# Altium schematic sheet Top-Sheet.SchDoc
size 420 x 297 mm; SheetNumber: 1; SheetTotal: 6
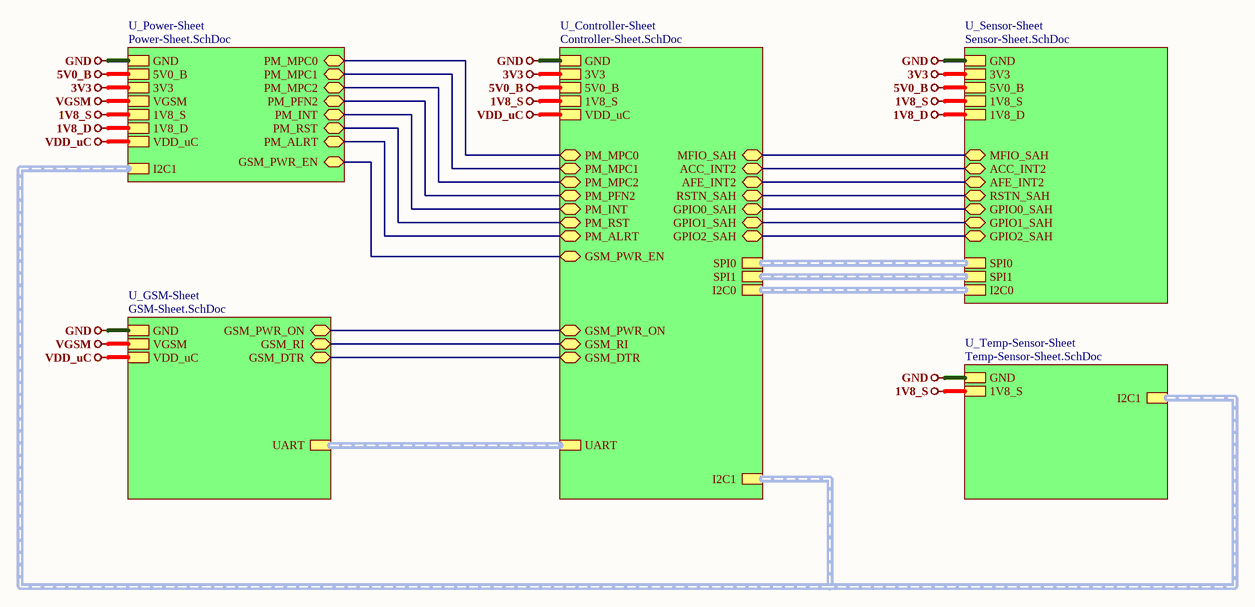
[diagram p0: Top-Sheet.SchDoc]

## Sub-sheets
U_Controller-Sheet = Controller-Sheet.SchDoc: I2C0 (harness I2C), GND, 3V3, I2C1 (harness I2C), SPI0 (harness I2C), SPI1 (harness I2C), UART (harness I2C), 5V0_B, 1V8_S, VDD_uC, PM_MPC0 (bidir), PM_MPC1 (bidir), PM_MPC2 (bidir), PM_PFN2 (bidir), PM_INT (bidir), PM_RST (bidir), PM_ALRT (bidir), GSM_PWR_EN (bidir), GSM_PWR_ON (bidir), GSM_RI (bidir), GSM_DTR (bidir), MFIO_SAH (bidir), ACC_INT2 (bidir), AFE_INT2 (bidir), RSTN_SAH (bidir), GPIO0_SAH (bidir), GPIO1_SAH (bidir), GPIO2_SAH (bidir)
U_GSM-Sheet = GSM-Sheet.SchDoc: GND, GSM_PWR_ON (bidir), UART (harness I2C), VGSM, VDD_uC, GSM_RI (bidir), GSM_DTR (bidir)
U_Power-Sheet = Power-Sheet.SchDoc: 5V0_B, GND, 3V3, VGSM, 1V8_S, 1V8_D, VDD_uC, I2C1 (harness I2C), PM_MPC0 (bidir), PM_MPC1 (bidir), PM_MPC2 (bidir), PM_PFN2 (bidir), PM_INT (bidir), PM_RST (bidir), PM_ALRT (bidir), GSM_PWR_EN (bidir)
U_Sensor-Sheet = Sensor-Sheet.SchDoc: I2C0 (harness I2C), GND, 3V3, SPI0 (harness I2C), SPI1 (harness I2C), 5V0_B, 1V8_S, 1V8_D, MFIO_SAH (bidir), ACC_INT2 (bidir), AFE_INT2 (bidir), RSTN_SAH (bidir), GPIO0_SAH (bidir), GPIO1_SAH (bidir), GPIO2_SAH (bidir)
U_Temp-Sensor-Sheet = Temp-Sensor-Sheet.SchDoc: I2C1 (harness I2C), GND, 1V8_S

## Nets
1V8_D: sheet U_Power-Sheet/1V8_D, sheet U_Sensor-Sheet/1V8_D
1V8_S: sheet U_Power-Sheet/1V8_S, sheet U_Controller-Sheet/1V8_S, sheet U_Sensor-Sheet/1V8_S, sheet U_Temp-Sensor-Sheet/1V8_S
3V3: sheet U_Power-Sheet/3V3, sheet U_Controller-Sheet/3V3, sheet U_Sensor-Sheet/3V3
5V0_B: sheet U_Power-Sheet/5V0_B, sheet U_Controller-Sheet/5V0_B, sheet U_Sensor-Sheet/5V0_B
GND: sheet U_Power-Sheet/GND, sheet U_GSM-Sheet/GND, sheet U_Controller-Sheet/GND, sheet U_Sensor-Sheet/GND, sheet U_Temp-Sensor-Sheet/GND
VDD_uC: sheet U_Power-Sheet/VDD_uC, sheet U_GSM-Sheet/VDD_uC, sheet U_Controller-Sheet/VDD_uC
VGSM: sheet U_Power-Sheet/VGSM, sheet U_GSM-Sheet/VGSM
(unnamed): sheet U_Power-Sheet/PM_MPC0, sheet U_Controller-Sheet/PM_MPC0
(unnamed): sheet U_Power-Sheet/PM_MPC1, sheet U_Controller-Sheet/PM_MPC1
(unnamed): sheet U_Power-Sheet/PM_MPC2, sheet U_Controller-Sheet/PM_MPC2
(unnamed): sheet U_Power-Sheet/PM_PFN2, sheet U_Controller-Sheet/PM_PFN2
(unnamed): sheet U_Power-Sheet/PM_INT, sheet U_Controller-Sheet/PM_INT
(unnamed): sheet U_Power-Sheet/PM_RST, sheet U_Controller-Sheet/PM_RST
(unnamed): sheet U_Power-Sheet/PM_ALRT, sheet U_Controller-Sheet/PM_ALRT
(unnamed): sheet U_Power-Sheet/GSM_PWR_EN, sheet U_Controller-Sheet/GSM_PWR_EN
(unnamed): sheet U_GSM-Sheet/GSM_PWR_ON, sheet U_Controller-Sheet/GSM_PWR_ON
(unnamed): sheet U_GSM-Sheet/GSM_RI, sheet U_Controller-Sheet/GSM_RI
(unnamed): sheet U_GSM-Sheet/GSM_DTR, sheet U_Controller-Sheet/GSM_DTR
(unnamed): sheet U_Controller-Sheet/MFIO_SAH, sheet U_Sensor-Sheet/MFIO_SAH
(unnamed): sheet U_Controller-Sheet/ACC_INT2, sheet U_Sensor-Sheet/ACC_INT2
(unnamed): sheet U_Controller-Sheet/AFE_INT2, sheet U_Sensor-Sheet/AFE_INT2
(unnamed): sheet U_Controller-Sheet/RSTN_SAH, sheet U_Sensor-Sheet/RSTN_SAH
(unnamed): sheet U_Controller-Sheet/GPIO0_SAH, sheet U_Sensor-Sheet/GPIO0_SAH
(unnamed): sheet U_Controller-Sheet/GPIO1_SAH, sheet U_Sensor-Sheet/GPIO1_SAH
(unnamed): sheet U_Controller-Sheet/GPIO2_SAH, sheet U_Sensor-Sheet/GPIO2_SAH

## Buses and harness runs
harness sheet U_Controller-Sheet/I2C0 = sheet U_Sensor-Sheet/I2C0
harness sheet U_Controller-Sheet/I2C1 = sheet U_Power-Sheet/I2C1 = sheet U_Temp-Sensor-Sheet/I2C1
harness sheet U_Controller-Sheet/SPI0 = sheet U_Sensor-Sheet/SPI0
harness sheet U_Controller-Sheet/SPI1 = sheet U_Sensor-Sheet/SPI1
harness sheet U_Controller-Sheet/UART = sheet U_GSM-Sheet/UART

## Notes on the sheet
- File:
- Title:
- Date:
- Page
- Num:
- Total:
- Drawn By: Huzaifa Ali